# Altium schematic sheet Control.SchDoc
size A4; SheetNumber: 1; SheetTotal: 2
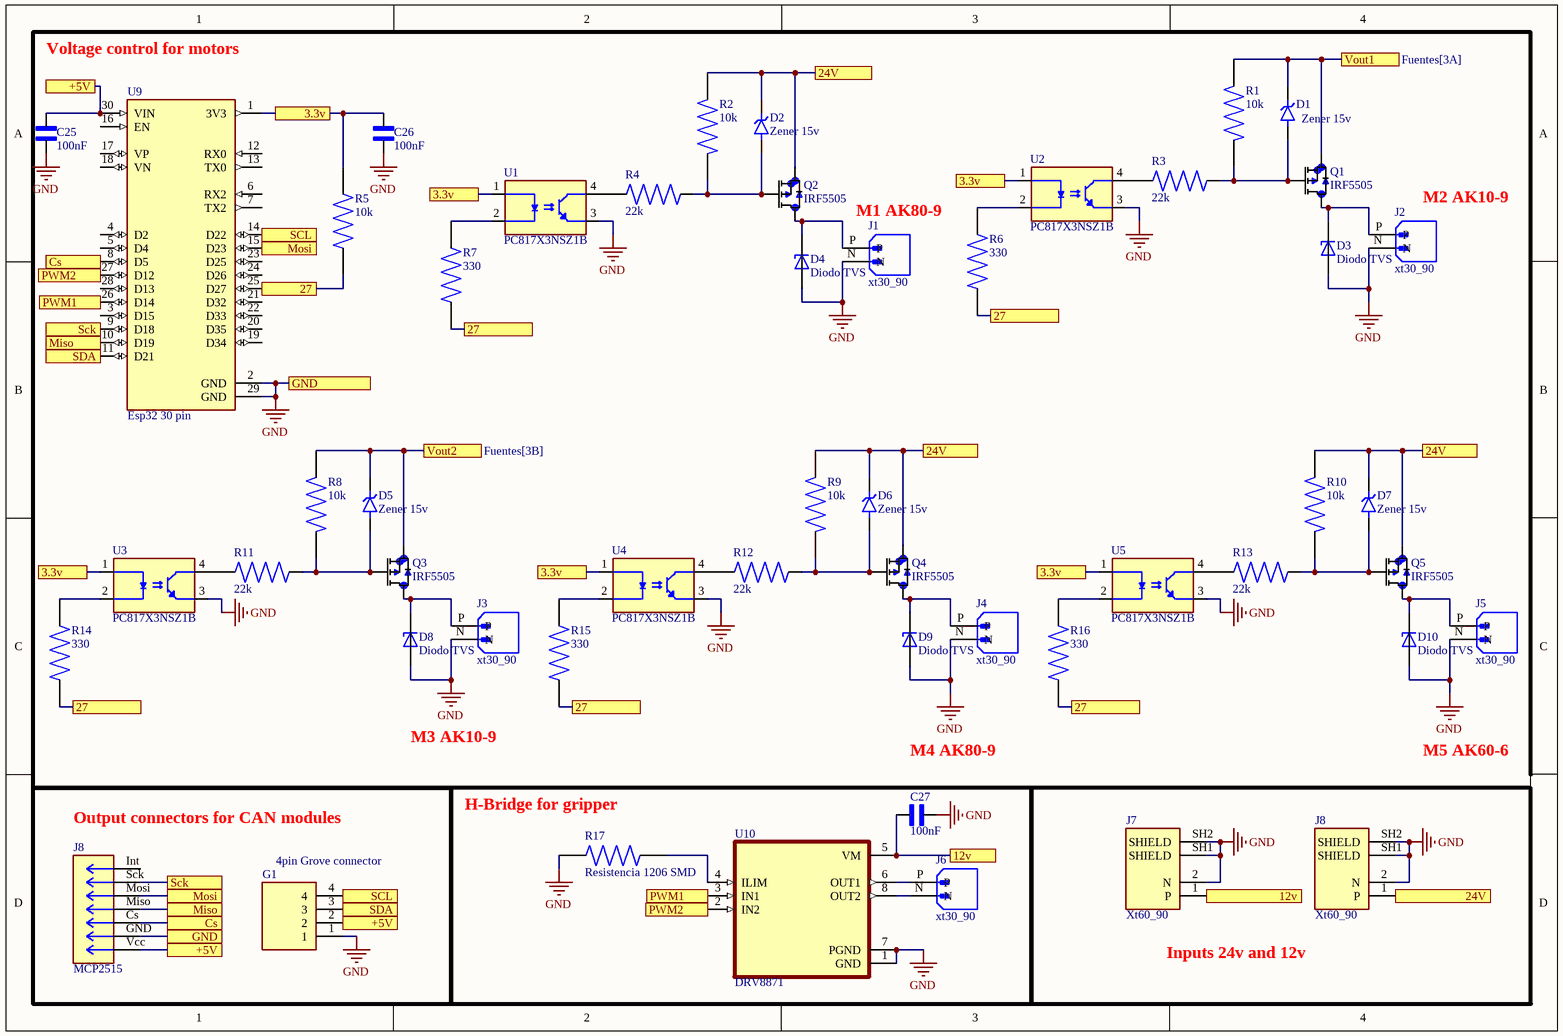
[diagram p0: Control.SchDoc]

## Parts
(Parts that share a designator on the sheet are numbered #1, #2 ... from top to bottom, then left to right.)
C25  100nF  [Cap SMD 1206]
C26  100nF  [Cap SMD 1206]
C27  100nF  [Cap SMD 1206]
D1  Zener 15v  [Zener 15v 500mW SMD]
D2  Zener 15v  [Zener 15v 500mW SMD]
D3  Diodo TVS  [Diodo TVS]
D4  Diodo TVS  [Diodo TVS]
D5  Zener 15v  [Zener 15v 500mW SMD]
D6  Zener 15v  [Zener 15v 500mW SMD]
D7  Zener 15v  [Zener 15v 500mW SMD]
D8  Diodo TVS  [Diodo TVS]
D9  Diodo TVS  [Diodo TVS]
D10  Diodo TVS  [Diodo TVS]
G1  4pin Grove connector  [4 pin grove conector]
J1  xt30_90  [XT30_90]
J2  xt30_90  [XT30_90]
J3  xt30_90  [XT30_90]
J4  xt30_90  [XT30_90]
J5  xt30_90  [XT30_90]
J6  xt30_90  [XT30_90]
J7  Xt60_90  [Xt60_90]
J8#1  Xt60_90  [Xt60_90]
J8#2  MCP2515  [MCP2515]
Q1  IRF5505  [irf5505]
Q2  IRF5505  [irf5505]
Q3  IRF5505  [irf5505]
Q4  IRF5505  [irf5505]
Q5  IRF5505  [irf5505]
R1  10k  [Resistencia 1306]
R2  10k  [Resistencia 1306]
R3  22k  [Resistencia 1306]
R4  22k  [Resistencia 1306]
R5  10k  [Resistencia 1306]
R6  330  [Resistencia 1306]
R7  330  [Resistencia 1306]
R8  10k  [Resistencia 1306]
R9  10k  [Resistencia 1306]
R10  10k  [Resistencia 1306]
R11  22k  [Resistencia 1306]
R12  22k  [Resistencia 1306]
R13  22k  [Resistencia 1306]
R14  330  [Resistencia 1306]
R15  330  [Resistencia 1306]
R16  330  [Resistencia 1306]
R17  Resistencia 1206 SMD  [Resistencia 1306]
U1  PC817X3NSZ1B  [PC817X3NSZ1B]
U2  PC817X3NSZ1B  [PC817X3NSZ1B]
U3  PC817X3NSZ1B  [PC817X3NSZ1B]
U4  PC817X3NSZ1B  [PC817X3NSZ1B]
U5  PC817X3NSZ1B  [PC817X3NSZ1B]
U9  Esp32 30 pin  [ESP32 30 pin]
U10  DRV8871  [DRV8871]

## Blocks framed on the sheet
Output connectors for CAN modules: G1 J8#2
H-Bridge for gripper: C27 J6 R17 U10
Inputs 24v and 12v: J7 J8#1

## Ports
3.3v (see Control[1A], Control[1C], Control[2A], Control[2C], Control[3A], Fuentes[4C]), 3.3v (see Control[1A], Control[1C], Control[2A], Control[2C], Control[3C], Fuentes[4C]), 3.3v (see Control[1A], Control[1C], Control[2A], Control[3A], Control[3C], Fuentes[4C]), 3.3v (see Control[1A], Control[1C], Control[2C], Control[3A], Control[3C], Fuentes[4C]), 3.3v (see Control[1A], Control[2A], Control[2C], Control[3A], Control[3C], Fuentes[4C]), 3.3v (see Control[1C], Control[2A], Control[2C], Control[3A], Control[3C], Fuentes[4C]), 12v (see Control[3D]), 12v (see Control[4D]), 24V (see Control[3A], Control[3B], Control[4B], Fuentes[1A], Fuentes[1B], Fuentes[1C]), 24V (see Control[3A], Control[3B], Control[4D], Fuentes[1A], Fuentes[1B], Fuentes[1C]), 24V (see Control[3A], Control[4B], Control[4D], Fuentes[1A], Fuentes[1B], Fuentes[1C]), 24V (see Control[3B], Control[4B], Control[4D], Fuentes[1A], Fuentes[1B], Fuentes[1C]), 27 (see Control[1B], Control[1C], Control[2B], Control[2C], Control[3B], Fuentes[4C]), 27 (see Control[1B], Control[1C], Control[2B], Control[2C], Control[3C], Fuentes[4C]), 27 (see Control[1B], Control[1C], Control[2B], Control[3B], Control[3C], Fuentes[4C]), 27 (see Control[1B], Control[1C], Control[2C], Control[3B], Control[3C], Fuentes[4C]), 27 (see Control[1B], Control[2B], Control[2C], Control[3B], Control[3C], Fuentes[4C]), 27 (see Control[1C], Control[2B], Control[2C], Control[3B], Control[3C], Fuentes[4C]), +5V (see Control[1A], Control[1D]), +5V (see Control[1D]), Cs (see Control[1B]), Cs (see Control[1D]), GND (see Control[1B]), GND (see Control[1D]), Miso (see Control[1B]), Miso (see Control[1D]), Mosi (see Control[1A]), Mosi (see Control[1D]), PWM1 (see Control[1B]), PWM1 (see Control[2D]), PWM2 (see Control[1B]), PWM2 (see Control[2D]), Sck (see Control[1B]), Sck (see Control[1D]), SCL (see Control[1A]), SCL (see Control[1D]), SDA (see Control[1B]), SDA (see Control[1D]), Vout1 (see Fuentes[3A]), Vout2 (see Fuentes[3B])

## Nets
GND: C25.2 C26.2 C27.1 D3.A D4.A D8.A D9.A D10.A G1.1 J1.N J2.N J3.N J4.N J5.N J7.2(N) J7.SH1(SHIELD) J7.SH2(SHIELD) J8#1.2(N) J8#1.SH1(SHIELD) J8#1.SH2(SHIELD) J8#2.GND R17.2 U1.3(EMITTER) U2.3(EMITTER) U3.3(EMITTER) U4.3(EMITTER) U5.3(EMITTER) U9.2(GND) U9.29(GND) U10.1(GND) U10.7(PGND) ; port GND
3.3v: C26.1 R5.1 U1.1(ANODE) U2.1(ANODE) U3.1(ANODE) U4.1(ANODE) U5.1(ANODE) U9.1(3V3) ; port 3.3v
12v: C27.2 J7.1(P) U10.5(VM) ; port 12v
24V: D2.1(K) D6.1(K) D7.1(K) J8#1.1(P) Q2.3(S) Q4.3(S) Q5.3(S) R2.1 R9.1 R10.1 ; port 24V
27: R5.2 R6.2 R7.2 R14.2 R15.2 R16.2 U9.25(D27) ; port 27
+5V: C25.1 G1.2 J8#2.Vcc U9.30(VIN) ; port +5V
Cs: J8#2.Cs U9.8(D5) ; port Cs
Miso: J8#2.Miso U9.10(D19) ; port Miso
Mosi: J8#2.Mosi U9.15(D23) ; port Mosi
PWM1: U9.26(D14) U10.3(IN1) ; port PWM1
PWM2: U9.27(D12) U10.2(IN2) ; port PWM2
Sck: J8#2.Sck U9.9(D18) ; port Sck
SCL: G1.4 U9.14(D22) ; port SCL
SDA: G1.3 U9.11(D21) ; port SDA
Vout1: D1.1(K) Q1.3(S) R1.1 ; port Vout1
Vout2: D5.1(K) Q3.3(S) R8.1 ; port Vout2
NetD1_2: D1.2(A) Q1.1(G) R1.2 R3.2
NetD2_2: D2.2(A) Q2.1(G) R2.2 R4.2
NetD3_C: D3.C J2.P Q1.2(D)
NetD4_C: D4.C J1.P Q2.2(D)
NetD5_2: D5.2(A) Q3.1(G) R8.2 R11.2
NetD6_2: D6.2(A) Q4.1(G) R9.2 R12.2
NetD7_2: D7.2(A) Q5.1(G) R10.2 R13.2
NetD8_C: D8.C J3.P Q3.2(D)
NetD9_C: D9.C J4.P Q4.2(D)
NetD10_C: D10.C J5.P Q5.2(D)
NetJ6_N: J6.N U10.8(OUT2)
NetJ6_P: J6.P U10.6(OUT1)
NetR3_1: R3.1 U2.4(COLLECTOR)
NetR4_1: R4.1 U1.4(COLLECTOR)
NetR6_1: R6.1 U2.2(CATHODE)
NetR7_1: R7.1 U1.2(CATHODE)
NetR11_1: R11.1 U3.4(COLLECTOR)
NetR12_1: R12.1 U4.4(COLLECTOR)
NetR13_1: R13.1 U5.4(COLLECTOR)
NetR14_1: R14.1 U3.2(CATHODE)
NetR15_1: R15.1 U4.2(CATHODE)
NetR16_1: R16.1 U5.2(CATHODE)
NetR17_1: R17.1 U10.4(ILIM)

Not connected (* = marked no-connect by the designer): J8#2 Int(7); U9 3(D15) 4(D2) 5(D4) 6(RX2) 7(TX2) 12(RX0) 13(TX0) 16(EN) 17(VP) 18(VN) 19(D34) 20(D35) 21(D32) 22(D33) 23(D25) 24(D26) 28(D13)

## Notes on the sheet
- Voltage control for motors
- (near J1) M1 AK80-9
- (near J2) M2 AK10-9
- M3 AK10-9
- M4 AK80-9
- M5 AK60-6

## Library data of the parts
C25-C27 = Cap SMD 1206
D1 D2 D5-D7 = Zener 15v 500mW SMD
D3 D4 D8-D10 = Diodo TVS SMAJ51
R1-R17 = Resistencia 1306 SMD
U9 = Esp32 30 pin: Dual core, Wi-Fi: 2.4 GHz up to 150 Mbits/s,BLE (Bluetooth Low Energy) and legacy Bluetooth, 32 bits, Up to 240 MHz